# Altium schematic sheet Connectors.SchDoc
size A; SheetNumber: 2; SheetTotal: 5
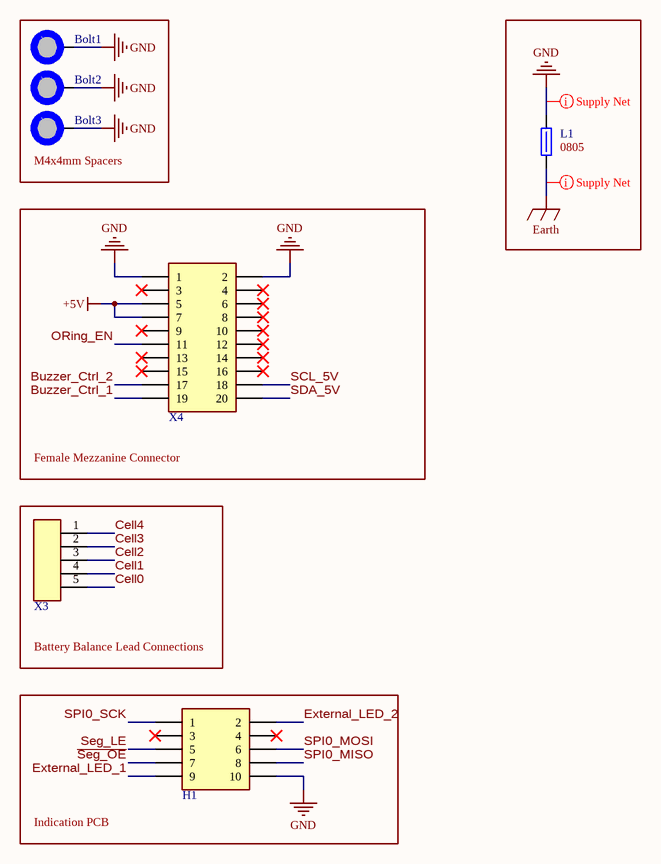
[diagram p0: Connectors.SchDoc]

## Parts
Bolt1  M4 4mm Spacer  [[Bolt] M4 len=4mm OD=6mm Spacer]  (value not drawn)
Bolt2  M4 4mm Spacer  [[Bolt] M4 len=4mm OD=6mm Spacer]  (value not drawn)
Bolt3  M4 4mm Spacer  [[Bolt] M4 len=4mm OD=6mm Spacer]  (value not drawn)
H1  2x5 Shrouded  [[Rectangular] Shrouded 2x5 Male]  (value not drawn)
L1  Size Package: 0805  [[Ferrite] SMD 0805]  (hidden comment: 652-MH2029-300Y)
X3  [JST] 5pin 90deg 2.54mm pitch  [[JST] 5pin 90deg 2.54mm pitch]  (value not drawn)
X4  [Mezzanine] 20pin H=4.0mm  [[Mezzanine] 20pin H=4.0mm Male]  (value not drawn)

## Blocks framed on the sheet
M4x4mm Spacers: Bolt1-Bolt3
Female Mezzanine Connector: X4
Battery Balance Lead Connections: X3
Indication PCB: H1

## Nets
+5V: X4.5 X4.7
Earth: L1.1
GND: Bolt1.1 Bolt2.1 Bolt3.1 H1.10 L1.2 X4.1 X4.2
~{Seg_OE}: H1.7
Buzzer_Ctrl_1: X4.19
Buzzer_Ctrl_2: X4.17
Cell0: X3.5
Cell1: X3.4
Cell2: X3.3
Cell3: X3.2
Cell4: X3.1
External_LED_1: H1.9
External_LED_2: H1.2
ORing_EN: X4.11
SCL_5V: X4.18
SDA_5V: X4.20
Seg_LE: H1.5
SPI0_MISO: H1.8
SPI0_MOSI: H1.6
SPI0_SCK: H1.1

Not connected (* = marked no-connect by the designer): H1 3* 4*; X4 3* 4* 6* 8* 9* 10* 12* 13* 14* 15* 16*

## Layout directives
net class Supply_Nets: Earth, GND

## Library data of the parts
Bolt1-Bolt3 = [Bolt] M4 len=4mm OD=6mm Spacer: ID: 4mm / OD: 6mm; ComponentLink1Description: McMaster Supplier; ComponentLink1URL: https://www.mcmaster.com/94669A006/
H1 = [Rectangular] Shrouded 2x5 Male: BHR-10-VUA; System: Connector; Supplier 1: DigiKey; Supplier Part Number 1: 2057-BHR-10-VUA-ND
L1 = [Ferrite] SMD 0805 3A 30ohm: Res @ Freq: 30 @ 100MHz; Supplier 1: DigiKey; Supplier Part Number 1: MH2029-300YCT-ND
X4 = [Mezzanine] 20pin H=4.0mm: DF40TC(4.0)-20DS-0.4V(58); System: Connector; Supplier 1: DigiKey; Supplier Part Number 1: 26-DF40TC(4.0)-20DS-0.4V(58)CT-ND